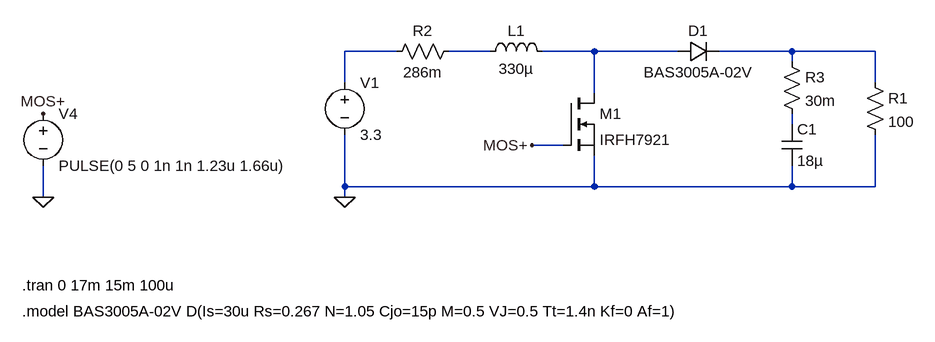
[diagram p0: schematic SteadyState_2 losses.asc]
SteadyState_2 losses.asc, the LTspice schematic file:
Version 4.1
SHEET 1 1908 680
WIRE 96 80 16 80
WIRE 240 80 176 80
WIRE 400 80 320 80
WIRE 528 80 400 80
WIRE 704 80 592 80
WIRE 832 80 704 80
WIRE 704 96 704 80
WIRE 16 128 16 80
WIRE 832 128 832 80
WIRE 400 144 400 80
WIRE 704 192 704 176
WIRE 352 224 304 224
WIRE 16 288 16 208
WIRE 400 288 400 240
WIRE 400 288 16 288
WIRE 704 288 704 256
WIRE 704 288 400 288
WIRE 832 288 832 208
WIRE 832 288 704 288
WIRE -448 304 -448 256
WIRE 16 304 16 288
FLAG 304 224 MOS+
FLAG 16 304 0
FLAG -448 304 0
FLAG -448 176 MOS+
SYMBOL voltage 16 112 R0
WINDOW 123 0 0 Left 0
WINDOW 39 0 0 Left 0
SYMATTR InstName V1
SYMATTR Value 3.3
SYMBOL ind 224 96 R270
WINDOW 0 32 56 VTop 2
WINDOW 3 5 56 VBottom 2
SYMATTR InstName L1
SYMATTR Value 330µ
SYMBOL diode 528 96 R270
WINDOW 0 32 32 VTop 2
WINDOW 3 0 32 VBottom 2
SYMATTR InstName D1
SYMATTR Value BAS3005A-02V
SYMBOL cap 688 192 R0
SYMATTR InstName C1
SYMATTR Value 18µ
SYMBOL res 816 112 R0
SYMATTR InstName R1
SYMATTR Value 100
SYMBOL nmos 352 144 R0
SYMATTR InstName M1
SYMATTR Value IRFH7921
SYMBOL res 192 64 R90
WINDOW 0 0 56 VBottom 2
WINDOW 3 32 56 VTop 2
SYMATTR InstName R2
SYMATTR Value 286m
SYMBOL res 688 80 R0
SYMATTR InstName R3
SYMATTR Value 30m
SYMBOL voltage -448 160 R0
WINDOW 123 0 0 Left 0
WINDOW 39 0 0 Left 0
SYMATTR InstName V4
SYMATTR Value PULSE(0 5 0 1n 1n 1.23u 1.66u)
TEXT -480 440 Left 2 !.tran 0 17m 15m 100u
TEXT -480 480 Left 2 !.model BAS3005A-02V D(Is=30u Rs=0.267 N=1.05 Cjo=15p M=0.5 VJ=0.5 Tt=1.4n Kf=0 Af=1)

The netlist it stands for:
* SteadyState_2 losses.asc
V1 N001 0 3.3
L1 N002 N003 330µ
D1 N003 N004 BAS3005A-02V
C1 N005 0 18µ
R1 N004 0 100
M1 N003 MOS+ 0 0 IRFH7921
R2 N002 N001 286m
R3 N004 N005 30m
V4 MOS+ 0 PULSE(0 5 0 1n 1n 1.23u 1.66u)
.model D D
.lib standard.dio
.model NMOS NMOS
.model PMOS PMOS
.lib standard.mos
.tran 0 17m 15m 100u
.model BAS3005A-02V D(Is=30u Rs=0.267 N=1.05 Cjo=15p M=0.5 VJ=0.5 Tt=1.4n Kf=0 Af=1)
.backanno
.end